# Altium schematic sheet waveform-output.SchDoc
size A; SheetNumber: 2; SheetTotal: 2
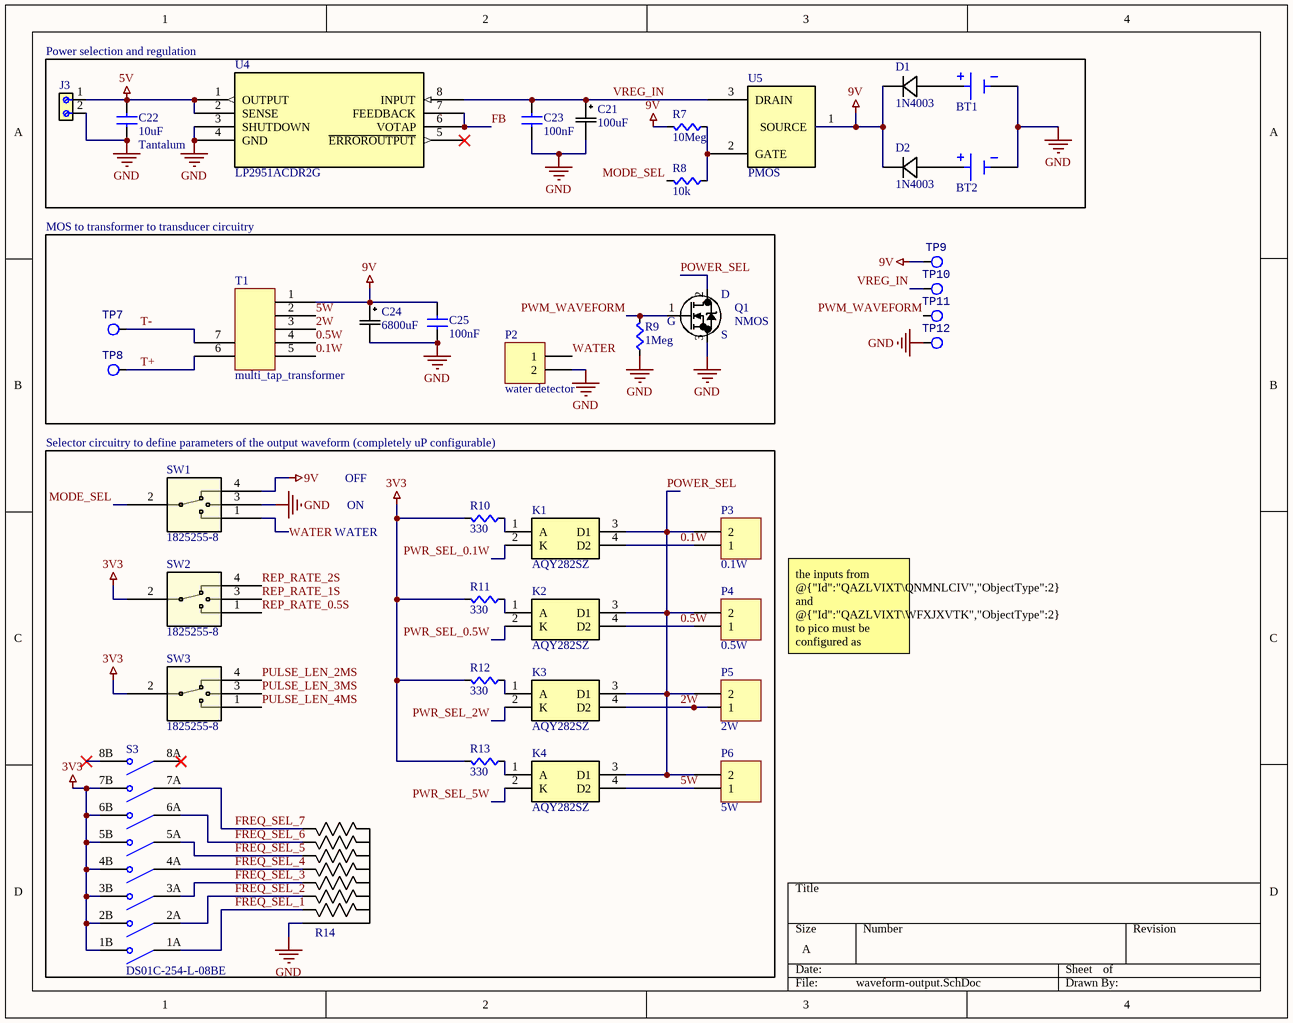
[diagram p0: waveform-output.SchDoc]

## Parts
BT1  593_594  [BAT_593]  (value not drawn)
BT2  593_594  [BAT_593]  (value not drawn)
C21  100uF  [CAP_SMT_RADIAL_W6.6MM_D6.3MM]
C22  Tantalum  value 10uF  [CAPC0603]
C23  value 100nF  [CAPC0603]  (hidden comment: Cap)
C24  6800uF  [CAP_TH_RADIAL_W18MM_D7.5MM]
C25  value 100nF  [CAPC0603]  (hidden comment: Cap)
D1  1N4003  [CR_1N4005_ONS]
D2  1N4003  [CR_1N4005_ONS]
J3  [Connector] 691213510002  [[CONNECTOR] 5MM_2PORT_SCREW]  (value not drawn)
K1  AQY282SZ  [AQY282SZ]
K2  AQY282SZ  [AQY282SZ]
K3  AQY282SZ  [AQY282SZ]
K4  AQY282SZ  [AQY282SZ]
P2  water detector  [HDR1X2]
P3  0.1W  [HDR1X2]
P4  0.5W  [HDR1X2]
P5  2W  [HDR1X2]
P6  5W  [HDR1X2]
Q1  NMOS  [TO-252AA]
R7  value 10Meg  [RES0603]  (hidden comment: Res)
R8  value 10k  [RES0603]  (hidden comment: Res)
R9  value 1Meg  [RES0603]  (hidden comment: Res)
R10  value 330  [RES0603]  (hidden comment: Res)
R11  value 330  [RES0603]  (hidden comment: Res)
R12  value 330  [RES0603]  (hidden comment: Res)
R13  value 330  [RES0603]  (hidden comment: Res)
R14  4608X-101-105LF  [BO_4608X]  (value not drawn)
S3  DS01C-254-L-08BE  [SW_DS01C-254-L-08BE]
SW1  1825255-8  [MHS-133_TEC]
SW2  1825255-8  [MHS-133_TEC]
SW3  1825255-8  [MHS-133_TEC]
T1  multi_tap_transformer  [multi_tap_transformer]
TP7  TP  [TPTH-100mil]  (value not drawn)  (no BOM)
TP8  TP  [TPTH-100mil]  (value not drawn)  (no BOM)
TP9  TP  [TPTH-100mil]  (value not drawn)  (no BOM)
TP10  TP  [TPTH-100mil]  (value not drawn)  (no BOM)
TP11  TP  [TPTH-100mil]  (value not drawn)  (no BOM)
TP12  TP  [TPTH-100mil]  (value not drawn)  (no BOM)
U4  LP2951ACDR2G  [SOIC8-3.9MM]
U5  PMOS  [TO-92]

## Blocks framed on the sheet
Power selection and regulation: BT1 BT2 C21-C23 D1 D2 J3 R7 R8 U4 U5
MOS to transformer to transducer circuitry: C24 C25 P2 Q1 R9 T1 TP7 TP8

## Nets
3V3: R10.2(B) R11.2(B) R12.2(B) R13.2(B) S3.1B(NO1) S3.2B(NO2) S3.3B(NO3) S3.4B(NO4) S3.5B(NO5) S3.6B(NO6) S3.7B(NO7) SW2.2 SW3.2
5V: C22.2(B) J3.1 U4.1(OUTPUT) U4.2(SENSE)
9V: C24.1 C25.1(A) D1.1 D2.1 R7.2(B) SW1.4 T1.1 TP9.1 U5.1(SOURCE)
GND: BT1.2(NEG) BT2.2(NEG) C21.2 C22.1(A) C23.2(B) C24.2 C25.2(B) J3.2 P2.2 Q1.3(S) R9.2(B) R14.1 SW1.3 TP12.1 U4.3(SHUTDOWN) U4.4(GND)
0.1W: K1.4(D2) P3.1 T1.5
0.5W: K2.4(D2) P4.1 T1.4
2W: K3.4(D2) P5.1 T1.3
5W: K4.4(D2) P6.1 T1.2
FB: U4.6(VOTAP) U4.7(FEEDBACK)
FREQ_SEL_1: R14.2 S3.1A(COM1)
FREQ_SEL_2: R14.3 S3.2A(COM2)
FREQ_SEL_3: R14.4 S3.3A(COM3)
FREQ_SEL_4: R14.5 S3.4A(COM4)
FREQ_SEL_5: R14.6 S3.5A(COM5)
FREQ_SEL_6: R14.7 S3.6A(COM6)
FREQ_SEL_7: R14.8 S3.7A(COM7)
MODE_SEL: R8.2(B) SW1.2
POWER_SEL: K1.3(D1) K2.3(D1) K3.3(D1) K4.3(D1) P3.2 P4.2 P5.2 P6.2 Q1.2(D)
PULSE_LEN_2MS: SW3.4
PULSE_LEN_3MS: SW3.3
PULSE_LEN_4MS: SW3.1
PWM_WAVEFORM: Q1.1(G) R9.1(A) TP11.1
PWR_SEL_0.1W: K1.2(K)
PWR_SEL_0.5W: K2.2(K)
PWR_SEL_2W: K3.2(K)
PWR_SEL_5W: K4.2(K)
REP_RATE_0.5S: SW2.1
REP_RATE_1S: SW2.3
REP_RATE_2S: SW2.4
T+: T1.6 TP8.1
T-: T1.7 TP7.1
VREG_IN: C21.1 C23.1(A) TP10.1 U4.8(INPUT) U5.3(DRAIN)
WATER: P2.1 SW1.1
NetBT1_1: BT1.1(NEG) D1.2
NetBT2_1: BT2.1(NEG) D2.2
NetK1_1: K1.1(A) R10.1(A)
NetK2_1: K2.1(A) R11.1(A)
NetK3_1: K3.1(A) R12.1(A)
NetK4_1: K4.1(A) R13.1(A)
NetR7_1: R7.1(A) R8.1(A) U5.2(GATE)

Not connected (* = marked no-connect by the designer): S3 8A(COM8)* 8B(NO8)*; U4 5(~{ERROROUTPUT})*

## Notes on the sheet
- (near SW1) Selector circuitry to define parameters of the output waveform (completely uP configurable)
- OFF
- ON
- WATER
- the inputs from @{"Id":"QAZLVIXT\QNMNLCIV","ObjectType":2} and @{"Id":"QAZLVIXT\WFXJXVTK","ObjectType":2} to pico must be configured as pulldown resistors in firmware

## Library data of the parts
BT1 BT2 = 593_594: Battery Contact Snap (Negative) 9V Cell PC Pin; MF: Keystone Electronics; MP: 593; Package: None; Price: None; Value: *; Availability: Unavailable
C21 = EXV107M025A9HAA: 100 µF 25 V Aluminum Electrolytic Capacitors Radial, Can - SMD 340mOhm @ 100kHz 3000 Hrs @ 105°C; Manufacturer_Name: Kemet; Copyright: Copyright (C) 2026 Ultra Librarian. All rights reserved.; Manufacturer_Part_Number: EXV107M025A9HAA
C22 = Cap: Supplier 1: Digi-Key; Supplier Part Number 1: 1276-1000-1-ND
C24 = UKL1A682KHD: 6800 µF 10 V Aluminum Electrolytic Capacitors Radial, Can 2000 Hrs @ 85°C; Manufacturer_Name: Nichicon; Copyright: Copyright (C) 2026 Ultra Librarian. All rights reserved.; Manufacturer_Part_Number: UKL1A682KHD; Digi-Key_Part_Number_1: UKL1A682KHD-ND
D1 D2 = 1N4003: Diode 200 V 1A Through Hole DO-41; Manufacturer_Name: onsemi; Copyright: Copyright (C) 2025 Ultra Librarian. All rights reserved.; Manufacturer_Part_Number: 1N4003
J3 = [Connector] 691213510002: 2 Position Wire to Board Terminal Block Horizontal with Board 0.200 (5.08mm) Through Hole; MF: WÃ¼rth Elektronik; SnapEDA_Link: https://www.snapeda.com/parts/691213510002/W%25C3%25BCrth+Elektronik+Midcom/view-part/?ref=snap; Package: None; Value: *; MP: 691213510002; Check_prices: https://www.snapeda.com/parts/691213510002/W%25C3%25BCrth+Elektronik+Midcom/view-part/?ref=eda
K1-K4 = AQY282SZ: Solid State Relays - PCB Mount 60v 500mA SOP Form A Norm-Open; Manufacturer_Name: Panasonic; Geometry.Height: 2.3mm; Mouser Part Number: 769-AQY282SZ; Mouser Price/Stock: https://www.mouser.co.uk/ProductDetail/Panasonic-Industrial-Devices/AQY282SZ?qs=2rFUEsTwVNwY5EkJsHQb1w%3D%3D; Manufacturer_Part_Number: AQY282SZ; Datasheet Link: https://media.digikey.com/pdf/Data%20Sheets/Panasonic%20Electric%20Works%20PDFs/AQY28_S_Spec.pdf
P2-P6 = Header 2: Header, 2-Pin; LatestRevisionDate: 17-Jul-2002; LatestRevisionNote: Re-released for DXP Platform.; Publisher: Altium Limited
Q1 = RFD14N05LSM: N-Channel 50 V 14A (Tc) 48W (Tc) Surface Mount TO-252AA; Manufacturer_Name: onsemi; Copyright: Copyright (C) 2025 Ultra Librarian. All rights reserved.; Manufacturer_Part_Number: RFD14N05LSM
R7-R13 = Res: SMD, RES0603; Supplier 1: Digi-Key; Supplier Part Number 1: RMCF0603JT10K0CT-ND
R14 = 4608X-101-105LF: 1M Ohm ±2% 200mW Power Per Element Bussed 7 Resistor Network/Array ±100ppm/°C 8-SIP; Manufacturer_Name: Bourns Electronics; Copyright: Copyright (C) 2026 Ultra Librarian. All rights reserved.; Manufacturer_Part_Number: 4608X-101-105LF
S3 = DS01C-254-L-08BE: 8 Position, Through Hole, 2.54 mm Pitch, Raised Slide Actuator, Convex Bottom, Long Pin, DIP Switch; MF: Same Sky; SnapEDA_Link: https://www.snapeda.com/parts/DS01C-254-L-08BE/Same+Sky/view-part/?ref=snap; Package: None; Value: *; MP: DS01C-254-L-08BE; Check_prices: https://www.snapeda.com/parts/DS01C-254-L-08BE/Same+Sky/view-part/?ref=eda
SW1-SW3 = 1825255-8: MHS133G04=SP3T SL SW VERT AU; Manufacturer_Name: TE Connectivity; Type: Slide Switches; Copyright: Copyright (C) 2025 Ultra Librarian. All rights reserved.; Manufacturer_Part_Number: 1825255-8; RefDes: RefDes
TP7-TP12 = TP: Test Point
U4 = LP2951ACDR2G: Linear Voltage Regulator IC Positive Adjustable (Fixed) 1 Output 100mA 8-SOIC; Manufacturer_Name: onsemi; Copyright: Copyright (C) 2026 Ultra Librarian. All rights reserved.; Manufacturer_Part_Number: LP2951ACDR2G; RefDes: RefDes; Type: Type
U5 = VP0808L-G: P-Channel 80 V 280mA (Tj) 1W (Tc) Through Hole TO-92-3; Manufacturer_Name: Microchip; Copyright: Copyright (C) 2026 Ultra Librarian. All rights reserved.; Manufacturer_Part_Number: VP0808L-G; RefDes: RefDes; Type: Type
C23 C25 = Cap: Supplier 1: Digi-Key; Supplier Part Number 1: 1276-1000-1-ND